# Altium project LM96000.PrjPcb
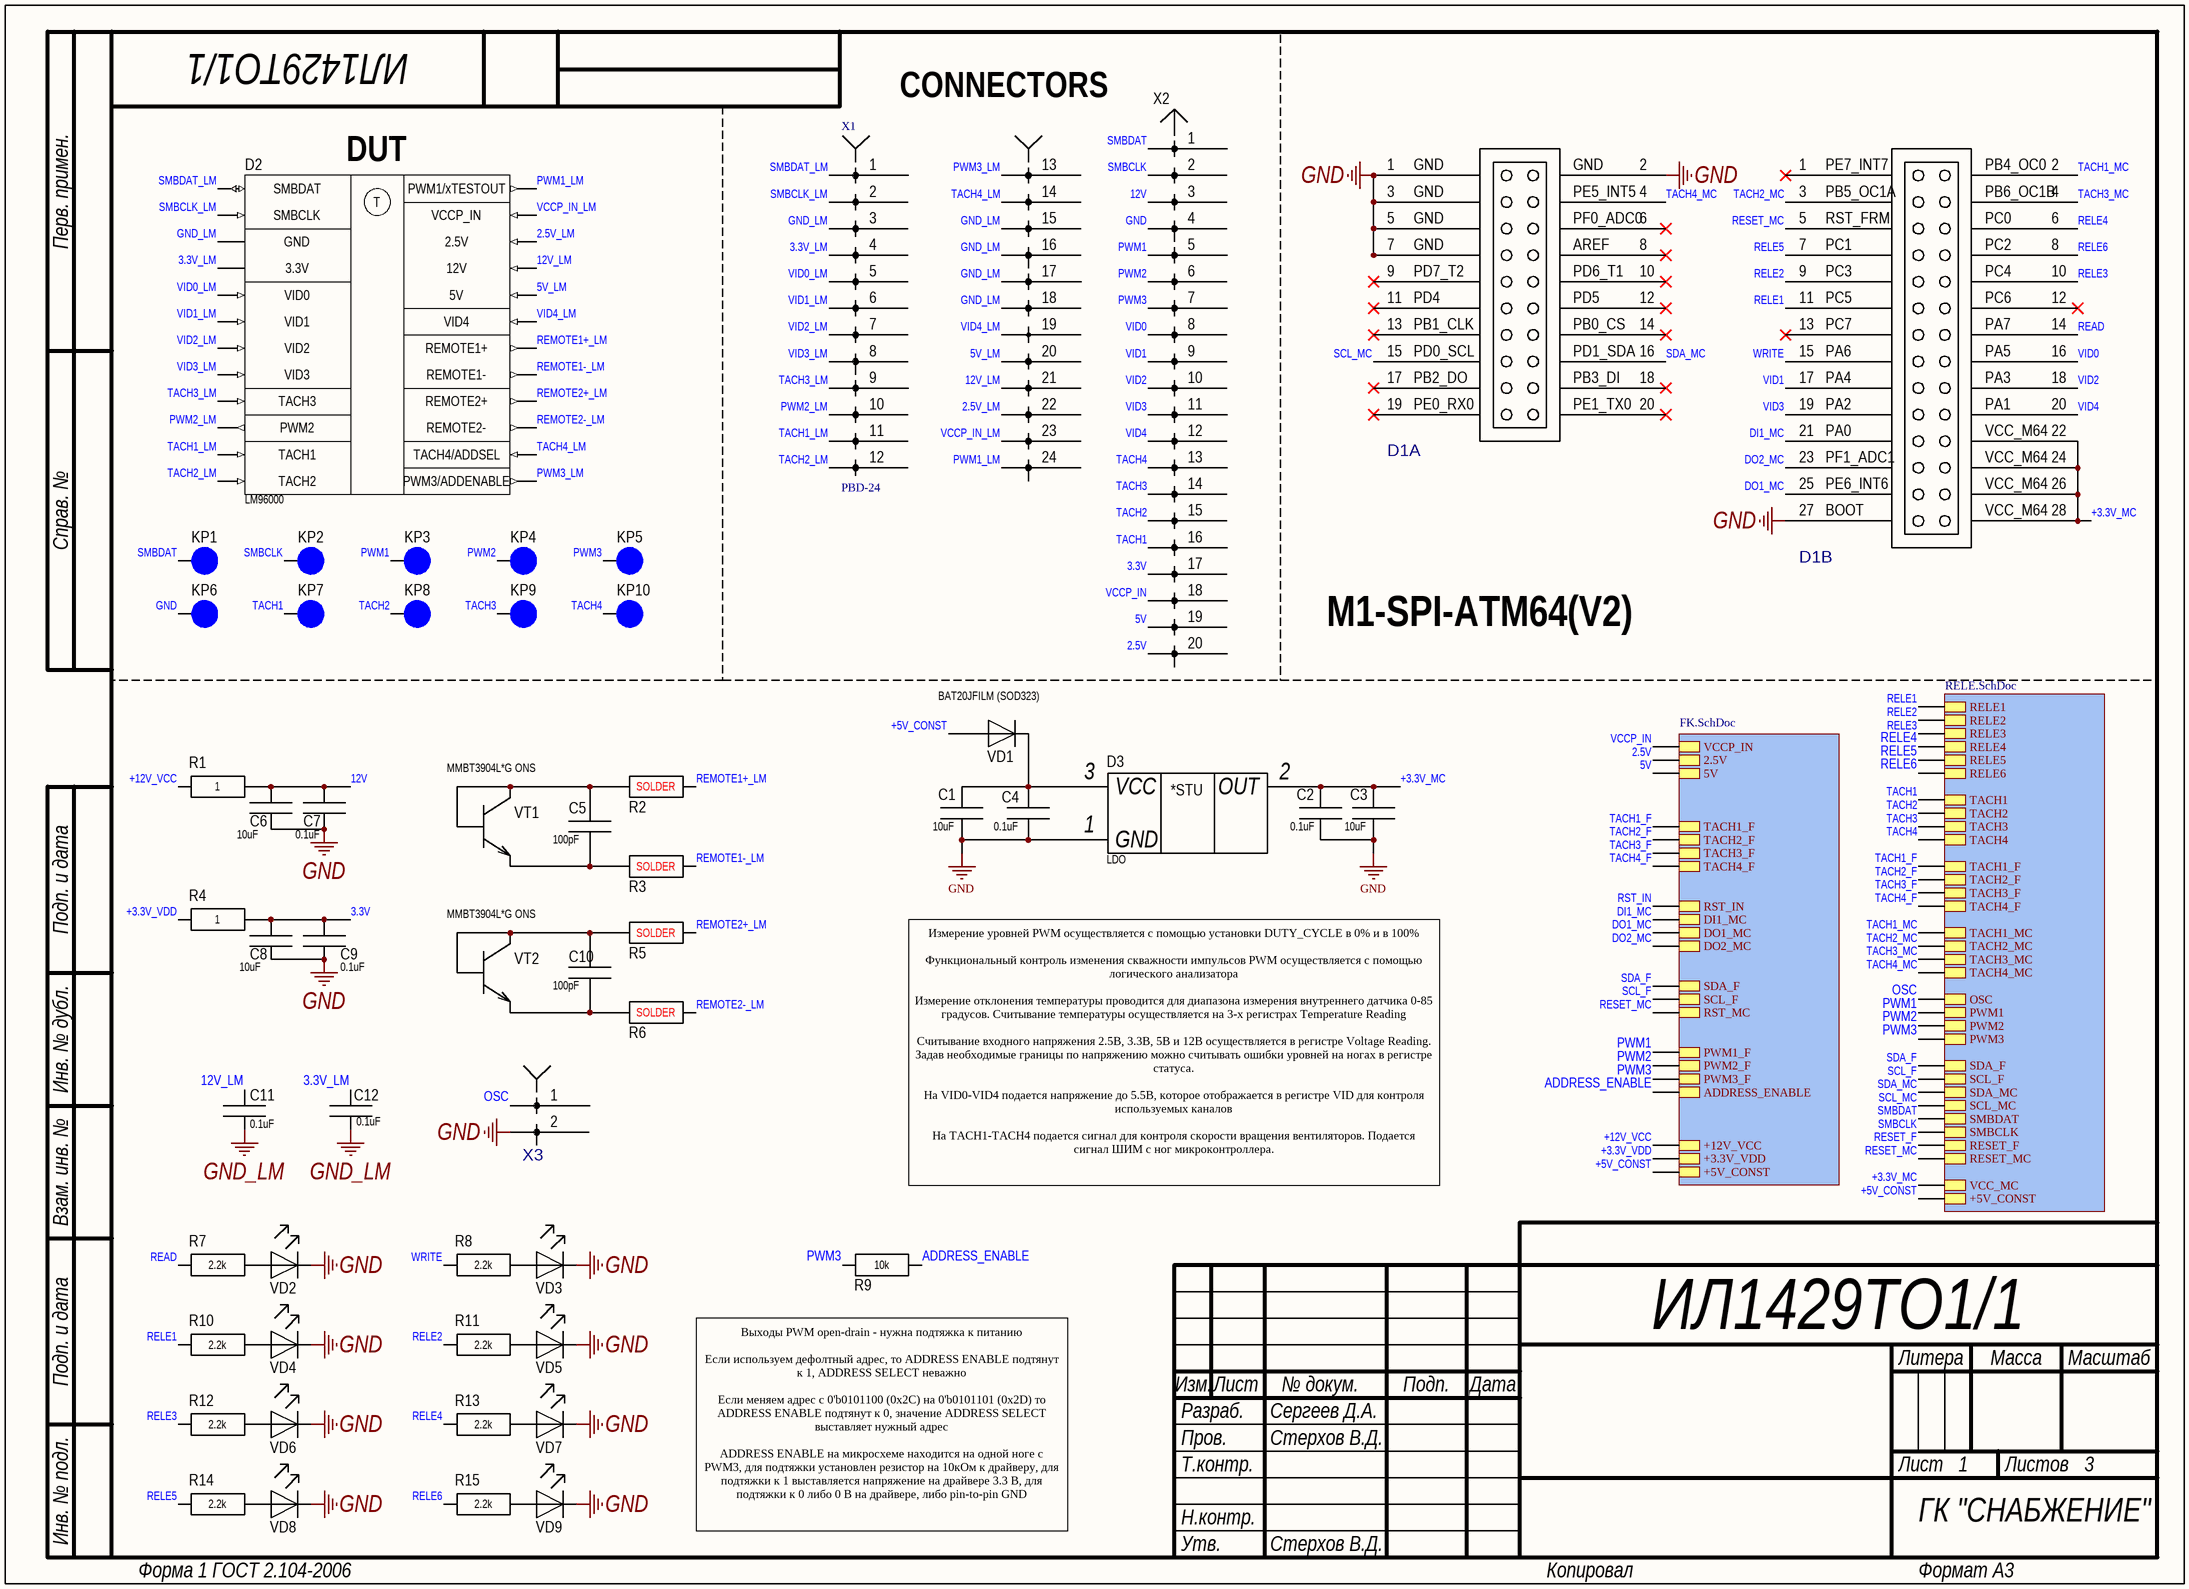
[diagram p0: main.SchDoc]
3 sheets, 104 parts. Net scope: hierarchical (ports join the sheet entries above them; power ports are global).
Board file: PCB1.PcbDoc
Sheets:
  main.SchDoc
    UCP_s25 = RELE.SchDoc
    UCP_s26 = FK.SchDoc

## Sheet main.SchDoc: ИЛ1429ТО1/1
size 410 x 297 mm; ApprovedBy: Стерхов В.Д.; CheckedBy: Стерхов В.Д.; Author: Сергеев Д.А.; CompanyName: ГК "СНАБЖЕНИЕ"; DrawnBy: Сергеев Д.А.; Engineer: Сергеев Д.А.; Organization: ГК "СНАБЖЕНИЕ"; DocumentNumber: ИЛ1429ТО1/1; Revision: 1; SheetNumber: 1; SheetTotal: 3

### Parts
C1  10uF  [0805]
C2  0.1uF  [0805]
C3  10uF  [0805]
C4  0.1uF  [0805]
C5  100pF  [0805]
C6  10uF  [0805]
C7  0.1uF  [0805]
C8  10uF  [0805]
C9  0.1uF  [0805]
C10  100pF  [0805]
C11  0.1uF  [0805]
C12  0.1uF  [0805]
D1  M1-SPI-ATM64(V2)  [M1-SPI-ATM64(V2)]  (value not drawn)  (parts A,B of 2)
D2  LM96000  [TSSOP-24 DIP-7.62]
D3  LDO  [SOT-223]
KP1  Contact  [Contact]  (value not drawn)
KP2  Contact  [Contact]  (value not drawn)
KP3  Contact  [Contact]  (value not drawn)
KP4  Contact  [Contact]  (value not drawn)
KP5  Contact  [Contact]  (value not drawn)
KP6  Contact  [Contact]  (value not drawn)
KP7  Contact  [Contact]  (value not drawn)
KP8  Contact  [Contact]  (value not drawn)
KP9  Contact  [Contact]  (value not drawn)
KP10  Contact  [Contact]  (value not drawn)
R1  1  [0805]
R2  SOLDER  [0603]
R3  SOLDER  [0603]
R4  1  [0805]
R5  SOLDER  [0603]
R6  SOLDER  [0603]
R7  2.2k  [0805]
R8  2.2k  [0805]
R9  10k  [0603]
R10  2.2k  [0805]
R11  2.2k  [0805]
R12  2.2k  [0805]
R13  2.2k  [0805]
R14  2.2k  [0805]
R15  2.2k  [0805]
VD1  BAT20JFILM (SOD323)  [SOD323]
VD2  LED(0805)  [0805(LED)]  (value not drawn)
VD3  LED(0805)  [0805(LED)]  (value not drawn)
VD4  LED(0805)  [0805(LED)]  (value not drawn)
VD5  LED(0805)  [0805(LED)]  (value not drawn)
VD6  LED(0805)  [0805(LED)]  (value not drawn)
VD7  LED(0805)  [0805(LED)]  (value not drawn)
VD8  LED(0805)  [0805(LED)]  (value not drawn)
VD9  LED(0805)  [0805(LED)]  (value not drawn)
VT1  MMBT3904L*G ONS  [SOT-23]
VT2  MMBT3904L*G ONS  [SOT-23]
X1  PBD-24  [PBD-24]
X2  PLD20-2,54  [PLD20-2,54]  (value not drawn)
X3  KLS1-SMA002-B  [KLS1-SMA002-B]  (value not drawn)

### Sub-sheets
UCP_s25 = RELE.SchDoc: SCL_F, +5V_CONST, RELE1, RELE2, RELE3, RESET_F, SDA_MC, VCC_MC, SCL_MC, SDA_F, RESET_MC, TACH2_MC, TACH4, TACH4_MC, TACH3_MC, TACH3, TACH1, TACH1_MC, TACH2, TACH3_F, TACH4_F, TACH1_F, TACH2_F, SMBCLK, SMBDAT, RELE6, RELE5, OSC, RELE4, PWM3, PWM2, PWM1
UCP_s26 = FK.SchDoc: 2.5V, TACH1_F, 5V, DI1_MC, RST_IN, TACH4_F, TACH3_F, TACH2_F, VCCP_IN, SDA_F, +5V_CONST, DO2_MC, RST_MC, SCL_F, DO1_MC, +12V_VCC, +3.3V_VDD, PWM2_F, PWM3_F, PWM1_F, ADDRESS_ENABLE

### Nets
GND: C1.2 C2.2 C3.2 C4.2 C6.2 C7.2 C8.2 C9.2 D1.1X2 D1.2X2 D1.3X2 D1.5X2 D1.7X2 D1.27X3 D3.1(GND) KP6.1 VD2.2(K) VD3.2(K) VD4.2(K) VD5.2(K) VD6.2(K) VD7.2(K) VD8.2(K) VD9.2(K) X2.4 X3.2
GND_LM: C11.2 C12.2 D2.3 X1.3 X1.15 X1.16 X1.17 X1.18
2.5V: X2.20 ; sheet UCP_s26/2.5V
2.5V_LM: D2.22 X1.22
3.3V: C8.1 C9.1 R4.2 X2.17
3.3V_LM: C12.1 D2.4 X1.4
5V: X2.19 ; sheet UCP_s26/5V
5V_LM: D2.20 X1.20
12V: C6.1 C7.1 R1.2 X2.3
12V_LM: C11.1 D2.21 X1.21
+3.3V_MC: C2.1 C3.1 D1.22X3 D1.24X3 D1.26X3 D1.28X3 D3.2(OUT) ; sheet UCP_s25/VCC_MC
+3.3V_VDD: R4.1 ; sheet UCP_s26/+3.3V_VDD
+5V_CONST: VD1.1(A) ; sheet UCP_s25/+5V_CONST, sheet UCP_s26/+5V_CONST
+12V_VCC: R1.1 ; sheet UCP_s26/+12V_VCC
ADDRESS_ENABLE: R9.2 ; sheet UCP_s26/ADDRESS_ENABLE
DI1_MC: D1.21X3 ; sheet UCP_s26/DI1_MC
DO1_MC: D1.25X3 ; sheet UCP_s26/DO1_MC
DO2_MC: D1.23X3 ; sheet UCP_s26/DO2_MC
OSC: X3.1 ; sheet UCP_s25/OSC
PWM1: KP3.1 X2.5 ; sheet UCP_s25/PWM1, sheet UCP_s26/PWM1_F
PWM1_LM: D2.24 X1.24
PWM2: KP4.1 X2.6 ; sheet UCP_s25/PWM2, sheet UCP_s26/PWM2_F
PWM2_LM: D2.10 X1.10
PWM3: KP5.1 R9.1 X2.7 ; sheet UCP_s25/PWM3, sheet UCP_s26/PWM3_F
PWM3_LM: D2.13 X1.13
READ: D1.14X3 R7.1
RELE1: D1.11X3 R10.1 ; sheet UCP_s25/RELE1
RELE2: D1.9X3 R11.1 ; sheet UCP_s25/RELE2
RELE3: D1.10X3 R12.1 ; sheet UCP_s25/RELE3
RELE4: D1.6X3 R13.1 ; sheet UCP_s25/RELE4
RELE5: D1.7X3 R14.1 ; sheet UCP_s25/RELE5
RELE6: D1.8X3 R15.1 ; sheet UCP_s25/RELE6
REMOTE1+_LM: D2.18 R2.2
REMOTE1-_LM: D2.17 R3.2
REMOTE2+_LM: D2.16 R5.2
REMOTE2-_LM: D2.15 R6.2
RESET_F: sheet UCP_s25/RESET_F
RESET_MC: D1.5X3 ; sheet UCP_s25/RESET_MC, sheet UCP_s26/RST_MC
SCL_F: sheet UCP_s25/SCL_F, sheet UCP_s26/SCL_F
SCL_MC: D1.15X2 ; sheet UCP_s25/SCL_MC
SDA_F: sheet UCP_s25/SDA_F, sheet UCP_s26/SDA_F
SDA_MC: D1.16X2 ; sheet UCP_s25/SDA_MC
SMBCLK: KP2.1 X2.2 ; sheet UCP_s25/SMBCLK
SMBCLK_LM: D2.2 X1.2
SMBDAT: KP1.1 X2.1 ; sheet UCP_s25/SMBDAT
SMBDAT_LM: D2.1 X1.1
TACH1: KP7.1 X2.16 ; sheet UCP_s25/TACH1
TACH1_F: sheet UCP_s25/TACH1_F, sheet UCP_s26/TACH1_F
TACH1_LM: D2.11 X1.11
TACH1_MC: D1.2X3 ; sheet UCP_s25/TACH1_MC
TACH2: KP8.1 X2.15 ; sheet UCP_s25/TACH2
TACH2_F: sheet UCP_s25/TACH2_F, sheet UCP_s26/TACH2_F
TACH2_LM: D2.12 X1.12
TACH2_MC: D1.3X3 ; sheet UCP_s25/TACH2_MC
TACH3: KP9.1 X2.14 ; sheet UCP_s25/TACH3
TACH3_F: sheet UCP_s25/TACH3_F, sheet UCP_s26/TACH3_F
TACH3_LM: D2.9 X1.9
TACH3_MC: D1.4X3 ; sheet UCP_s25/TACH3_MC
TACH4: KP10.1 X2.13 ; sheet UCP_s25/TACH4
TACH4_F: sheet UCP_s25/TACH4_F, sheet UCP_s26/TACH4_F
TACH4_LM: D2.14 X1.14
TACH4_MC: D1.4X2 ; sheet UCP_s25/TACH4_MC
VCCP_IN: X2.18 ; sheet UCP_s26/VCCP_IN
VCCP_IN_LM: D2.23 X1.23
VID0: D1.16X3 X2.8
VID0_LM: D2.5 X1.5
VID1: D1.17X3 X2.9
VID1_LM: D2.6 X1.6
VID2: D1.18X3 X2.10
VID2_LM: D2.7 X1.7
VID3: D1.19X3 X2.11
VID3_LM: D2.8 X1.8
VID4: D1.20X3 X2.12
VID4_LM: D2.19 X1.19
WRITE: D1.15X3 R8.1
NetC1_1: C1.1 C4.1 D3.3(VCC) VD1.2(K)
NetC5_1: C5.1 R2.1 VT1.1(B) VT1.3(K)
NetC5_2: C5.2 R3.1 VT1.2(E)
NetC10_1: C10.1 R5.1 VT2.1(B) VT2.3(K)
NetC10_2: C10.2 R6.1 VT2.2(E)
NetR7_2: R7.2 VD2.1(A)
NetR8_2: R8.2 VD3.1(A)
NetR10_2: R10.2 VD4.1(A)
NetR11_2: R11.2 VD5.1(A)
NetR12_2: R12.2 VD6.1(A)
NetR13_2: R13.2 VD7.1(A)
NetR14_2: R14.2 VD8.1(A)
NetR15_2: R15.2 VD9.1(A)

Not connected (* = marked no-connect by the designer): D1 1X3* 6X2* 8X2* 9X2* 10X2* 11X2* 12X2* 12X3* 13X2* 13X3* 14X2* 17X2* 18X2* 19X2* 20X2*

### Notes on the sheet
- CONNECTORS
- (near D2) DUT
- M1-SPI-ATM64(V2)
- Измерение уровней PWM осуществляется с помощью установки DUTY_CYCLE в 0% и в 100%
  Функциональный контроль изменения скважности импульсов PWM осуществляется с помощью логического анализатора
  Измерение отклонения температуры проводится для диапазона измерения внутреннего датчика 0-85 градусов. Считывание температуры осуществляется на 3-х регистрах Temperature Reading
  Считывание входного напряжения 2.5В, 3.3В, 5В и 12В осуществляется в регистре Voltage Reading. Задав необходимые границы по напряжению можно считывать ошибки уровней на ногах в регистре статуса.
  На VID0-VID4 подается напряжение до 5.5В, которое отображается в регистре VID для контроля используемых каналов
  На TACH1-TACH4 подается сигнал для контроля скорости вращения вентиляторов. Подается сигнал ШИМ с ног микроконтроллера.
- (near R9) Выходы PWM open-drain - нужна подтяжка к питанию
  Если используем дефолтный адрес, то ADDRESS ENABLE подтянут к 1, ADDRESS SELECT неважно
  Если меняем адрес с 0'b0101100 (0x2C) на 0'b0101101 (0x2D) то ADDRESS ENABLE подтянут к 0, значение ADDRESS SELECT выставляет нужный адрес
  ADDRESS ENABLE на микросхеме находится на одной ноге с PWM3, для подтяжки установлен резистор на 10кОм к драйверу, для подтяжки к 1 выставляется напряжение на драйвере 3.3 В, для подтяжки к 0 либо 0 В на драйвере, либо pin-to-pin GND
- Перв. примен.
- Справ. №
- Подп. и дата
- Инв. № дубл.
- Взам. инв. №
- Разраб.
- Изм.
- Лист
- № докум.
- Подп.
- Дата
- Литера
- Масса
- Масштаб
- Пров.
- Т.контр.
- Листов
- Инв. № подл.
- Н.контр.
- Утв.
- Форма 1 ГОСТ 2.104-2006
- Копировал
- Формат А3
- (in symbol OpAmpType3) OUT; V+; V-; DOP; +IN; -IN; EP

### Library data of the parts
C1-C12 = C0805: ComponentHeigt: 1.3; Firme: AVX; Leadform: SMD; KIND: Конденсатор; ClassName: *; Component Link: *; ComponentWeigt: *; Packaging: 0805; NN: *; Value: *
D1 = M1-SPI-ATM64(V2): ComponentHeigt: 5.5; Name: Вилка; Specification: Вилка PLD2-2 *; Typ: PLD2-2; ClassName: *; Component Link: *; ComponentWeigt: *; Firme: *; Leadform: *; NN: *; KIND: *
D3 = AMS1117-3.3 (SOT-223)
R1 R4 R7 R8 R10-R15 = R0805 Yageo: ComponentHeigt: 0.6; Firme: Yageo; Leadform: SMD; Kind: Резистор; ClassName: *; ComponentWeigt: *; Component Link: *; Packaging: 0805; NN: *; Value: *
R2 R3 R5 R6 R9 = R0603 Yageo: ComponentHeigt: 0.5; Leadform: SMD; Firme: Yageo; Kind: Резистор; Packaging: 0402; ClassName: *; Component Link: *; NN: *
VD1 = BAT20JFILM (SOD323): ComponentHeigt: 0.75; Leadform: в отверстия; Firme: Kingbright; NN: 24003000; KIND: Светодиод L-1154GD Kingbright; Component Link: *; ClassName: *
VD2-VD9 = LED(0805): ComponentHeigt: 0.75; Leadform: в отверстия; Firme: Kingbright; NN: 24003000; KIND: Светодиод L-1154GD Kingbright; Component Link: *; ClassName: *
VT1 VT2 = MMBT3904L*G ONS: ComponentHeigt: 1.1; Leadform: SMD; NN: 24006226; KIND: Транзистор MMBT3904L*G ONS; ClassName: *; ComponentWeigt: *; Firme: ONS; Packaging: SOT-23
X2 = PLD20-2,54: Посадочное место для проводов на ТО; ComponentHeigt: 5.5; Name: Вилка; Specification: Вилка PLD2-2 *; Typ: PLD2-2; ClassName: *; Component Link: *; ComponentWeigt: *; Firme: *; Leadform: *; NN: *; KIND: *
X3 = KLS1-SMA002-B: ComponentHeigt: 5.5; Name: Вилка; Specification: Вилка PLD2-2 *; Typ: PLD2-2; ClassName: *; Component Link: *; ComponentWeigt: *; Firme: *; Leadform: *; NN: *; KIND: *

## Sheet RELE.SchDoc: ИЛ1429ТО1/1
size 410 x 297 mm; ApprovedBy: Стерхов В.Д.; CheckedBy: Стерхов В.Д.; Author: Сергеев Д.А.; CompanyName: ГК "СНАБЖЕНИЕ"; DrawnBy: Сергеев Д.А.; Engineer: Сергеев Д.А.; Organization: ГК "СНАБЖЕНИЕ"; DocumentNumber: ИЛ1429ТО1/1; Revision: 1; SheetNumber: 2; SheetTotal: 3
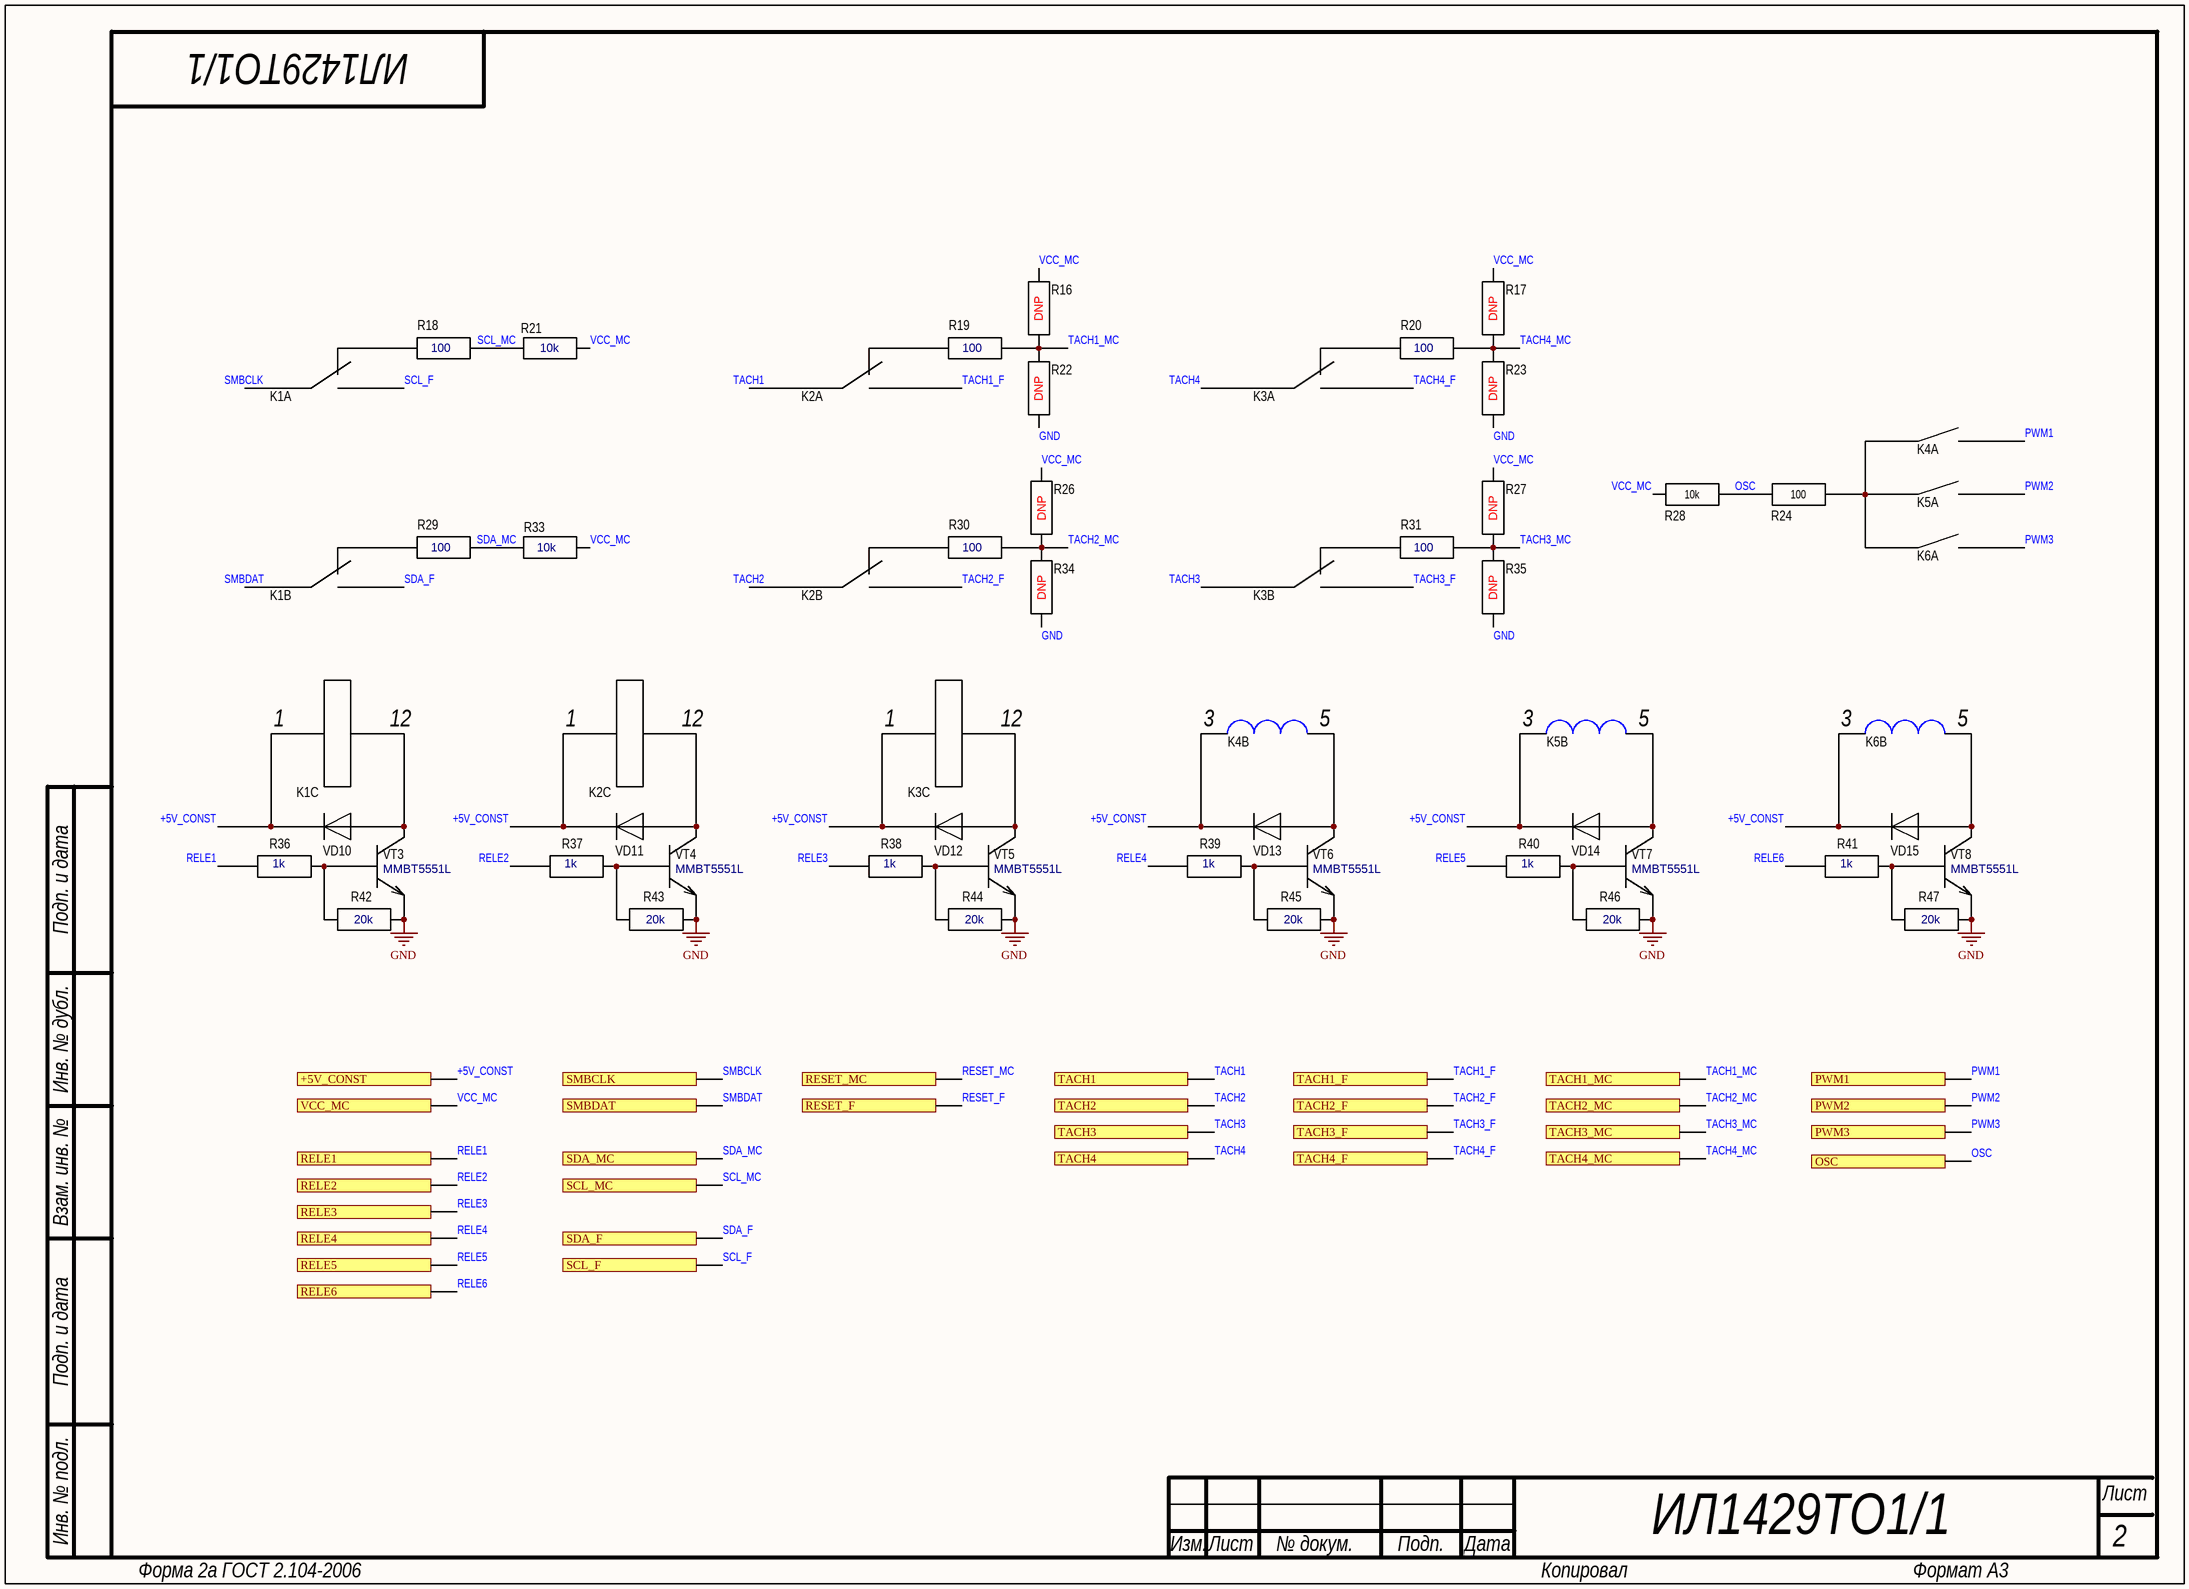
[diagram p1: RELE.SchDoc]

### Parts
K1  V23079A1001B301 TE  [V23079A1001B301]  (value not drawn)  (parts A,B,C of 3)
K2  V23079A1001B301 TE  [V23079A1001B301]  (value not drawn)  (parts A,B,C of 3)
K3  V23079A1001B301 TE  [V23079A1001B301]  (value not drawn)  (parts A,B,C of 3)
K4  TRR1A05F00  [TRR1A05F00]  (value not drawn)  (parts A,B of 2)
K5  TRR1A05F00  [TRR1A05F00]  (value not drawn)  (parts A,B of 2)
K6  TRR1A05F00  [TRR1A05F00]  (value not drawn)  (parts A,B of 2)
R16  DNP  [0805]
R17  DNP  [0805]
R18  100  [0805]
R19  100  [0805]
R20  100  [0805]
R21  10k  [0805]
R22  DNP  [0805]
R23  DNP  [0805]
R24  100  [0603]
R26  DNP  [0805]
R27  DNP  [0805]
R28  10k  [0603]
R29  100  [0805]
R30  100  [0805]
R31  100  [0805]
R33  10k  [0805]
R34  DNP  [0805]
R35  DNP  [0805]
R36  1k  [0805]
R37  1k  [0805]
R38  1k  [0805]
R39  1k  [0805]
R40  1k  [0805]
R41  1k  [0805]
R42  20k  [0805]
R43  20k  [0805]
R44  20k  [0805]
R45  20k  [0805]
R46  20k  [0805]
R47  20k  [0805]
VD10  LL4148 NXP  [SOD80C]  (value not drawn)
VD11  LL4148 NXP  [SOD80C]  (value not drawn)
VD12  LL4148 NXP  [SOD80C]  (value not drawn)
VD13  LL4148 NXP  [SOD80C]  (value not drawn)
VD14  LL4148 NXP  [SOD80C]  (value not drawn)
VD15  LL4148 NXP  [SOD80C]  (value not drawn)
VT3  MMBT5551L  [SOT-23]
VT4  MMBT5551L  [SOT-23]
VT5  MMBT5551L  [SOT-23]
VT6  MMBT5551L  [SOT-23]
VT7  MMBT5551L  [SOT-23]
VT8  MMBT5551L  [SOT-23]

### Ports
+5V_CONST, OSC, PWM1, PWM2, PWM3, RELE1, RELE2, RELE3, RELE4, RELE5, RELE6, RESET_F, RESET_MC, SCL_F, SCL_MC, SDA_F, SDA_MC, SMBCLK, SMBDAT, TACH1, TACH1_F, TACH1_MC, TACH2, TACH2_F, TACH2_MC, TACH3, TACH3_F, TACH3_MC, TACH4, TACH4_F, TACH4_MC, VCC_MC

### Nets
GND: R22.1 R23.1 R34.1 R35.1 R42.2 R43.2 R44.2 R45.2 R46.2 R47.2 VT3.2(E) VT4.2(E) VT5.2(E) VT6.2(E) VT7.2(E) VT8.2(E)
+5V_CONST: K1.1 K2.1 K3.1 K4.3 K5.3 K6.3 VD10.2(K) VD11.2(K) VD12.2(K) VD13.2(K) VD14.2(K) VD15.2(K) ; port +5V_CONST
OSC: R24.1 R28.2 ; port OSC
PWM1: K4.7 ; port PWM1
PWM2: K5.7 ; port PWM2
PWM3: K6.7 ; port PWM3
RELE1: R36.1 ; port RELE1
RELE2: R37.1 ; port RELE2
RELE3: R38.1 ; port RELE3
RELE4: R39.1 ; port RELE4
RELE5: R40.1 ; port RELE5
RELE6: R41.1 ; port RELE6
RESET_F: port RESET_F
SCL_F: K1.5 ; port SCL_F
SCL_MC: R18.2 R21.1 ; port SCL_MC
SDA_F: K1.8 ; port SDA_F
SDA_MC: R29.2 R33.1 ; port SDA_MC
SMBCLK: K1.4 ; port SMBCLK
SMBDAT: K1.9 ; port SMBDAT
TACH1: K2.4 ; port TACH1
TACH1_F: K2.5 ; port TACH1_F
TACH1_MC: R16.1 R19.2 R22.2 ; port TACH1_MC
TACH2: K2.9 ; port TACH2
TACH2_F: K2.8 ; port TACH2_F
TACH2_MC: R26.1 R30.2 R34.2 ; port TACH2_MC
TACH3: K3.9 ; port TACH3
TACH3_F: K3.8 ; port TACH3_F
TACH3_MC: R27.1 R31.2 R35.2 ; port TACH3_MC
TACH4: K3.4 ; port TACH4
TACH4_F: K3.5 ; port TACH4_F
TACH4_MC: R17.1 R20.2 R23.2 ; port TACH4_MC
VCC_MC: R16.2 R17.2 R21.2 R26.2 R27.2 R28.1 R33.2 ; port VCC_MC  [project net +3.3V_MC]
NetK1_3: K1.3 R18.1
NetK1_10: K1.10 R29.1
NetK1_12: K1.12 VD10.1(A) VT3.3(K)
NetK2_3: K2.3 R19.1
NetK2_10: K2.10 R30.1
NetK2_12: K2.12 VD11.1(A) VT4.3(K)
NetK3_3: K3.3 R20.1
NetK3_10: K3.10 R31.1
NetK3_12: K3.12 VD12.1(A) VT5.3(K)
NetK4_1: K4.1 K5.1 K6.1 R24.2
NetK4_5: K4.5 VD13.1(A) VT6.3(K)
NetK5_5: K5.5 VD14.1(A) VT7.3(K)
NetK6_5: K6.5 VD15.1(A) VT8.3(K)
NetR36_2: R36.2 R42.1 VT3.1(B)
NetR37_2: R37.2 R43.1 VT4.1(B)
NetR38_2: R38.2 R44.1 VT5.1(B)
NetR39_2: R39.2 R45.1 VT6.1(B)
NetR40_2: R40.2 R46.1 VT7.1(B)
NetR41_2: R41.2 R47.1 VT8.1(B)

### Notes on the sheet
- Подп. и дата
- Инв. № дубл.
- Взам. инв. №
- Инв. № подл.
- Изм.
- Лист
- № докум.
- Подп.
- Дата
- Форма 2а ГОСТ 2.104-2006
- Копировал
- Формат А3

### Library data of the parts
R16-R23 R26 R27 R29-R31 R33-R47 = R0805 Yageo: as R1 on sheet main; ClassName: *; ComponentWeigt: *; Component Link: *; Packaging: 0805; NN: *; Value: *
R24 R28 = R0603 Yageo: as R2 on sheet main; Packaging: 0402; ClassName: *; Component Link: *; NN: *
VD10-VD15 = LL4148 NXP: ComponentHeigt: 1.6; Leadform: SMD; NN: 24009301; KIND: Диод LL4148 NXP; Component Link: http://www.nxp.com; Packaging: SOD-80C; ClassName: *; Firme: NXP
VT3-VT8 = MMBT5551L: ComponentHeigt: 1.1; Firme: ONS; Leadform: SMD; NN: 24007468; KIND: Транзистор MMBT5551L*G ONS; ClassName: *; ComponentWeigt: *; Packaging: SOT-23

## Sheet FK.SchDoc: ИЛ1429ТО1/1
size 410 x 297 mm; ApprovedBy: Стерхов В.Д.; CheckedBy: Стерхов В.Д.; Author: Сергеев Д.А.; CompanyName: ГК "СНАБЖЕНИЕ"; DrawnBy: Сергеев Д.А.; Engineer: Сергеев Д.А.; Organization: ГК "СНАБЖЕНИЕ"; DocumentNumber: ИЛ1429ТО1/1; Revision: 1; SheetNumber: 3; SheetTotal: 3
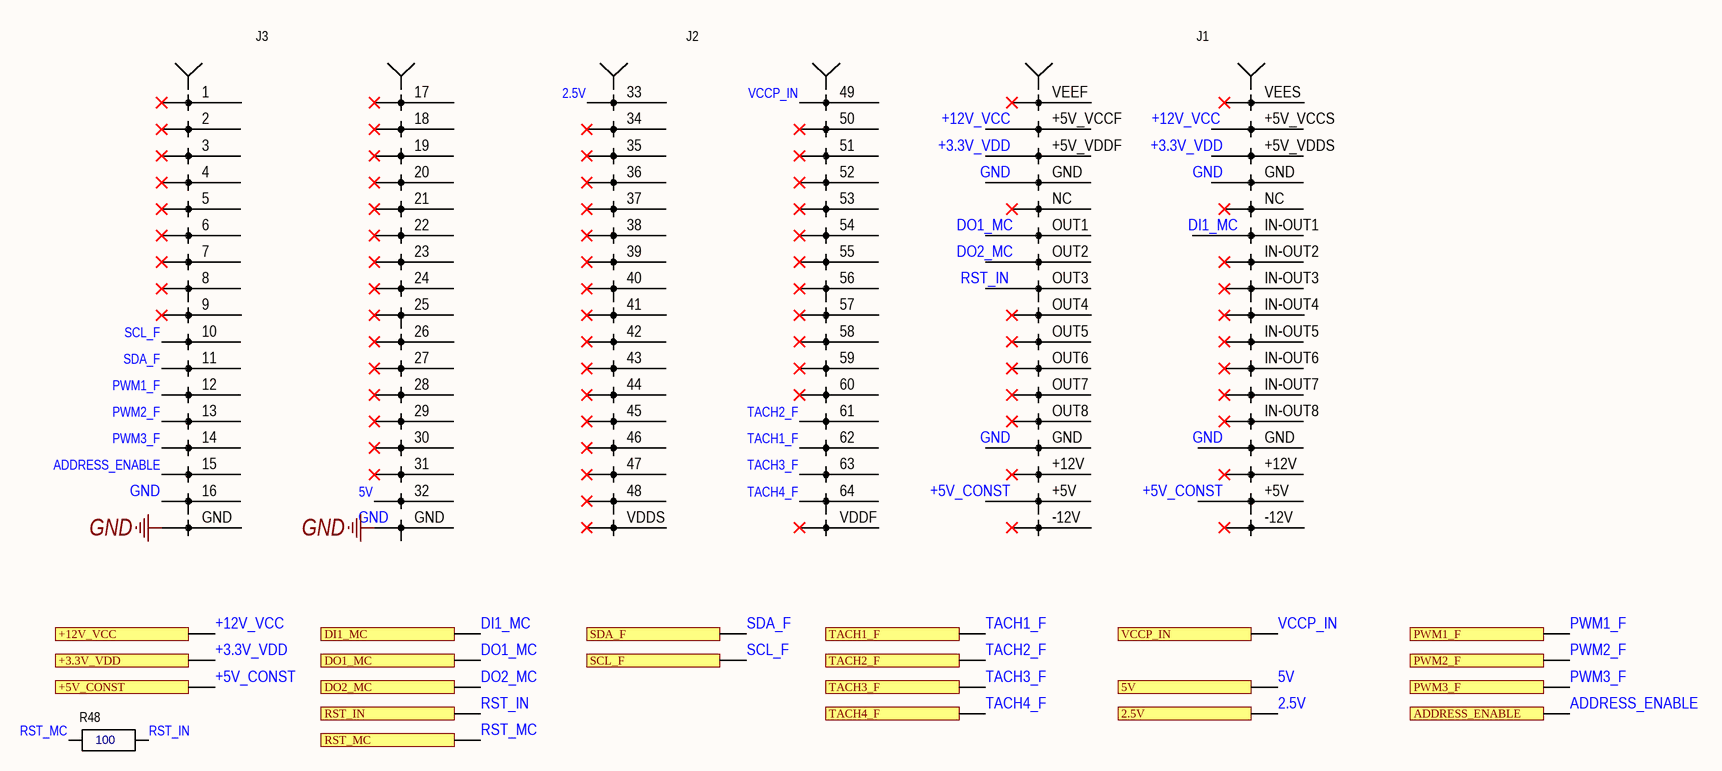
[diagram p2: FK.SchDoc]

### Parts
R48  100  [0805]
X4  FORMULA  [FORMULA]  (value not drawn)

### Ports
2.5V, 5V, +3.3V_VDD, +5V_CONST, +12V_VCC, ADDRESS_ENABLE, DI1_MC, DO1_MC, DO2_MC, PWM1_F, PWM2_F, PWM3_F, RST_IN, RST_MC, SCL_F, SDA_F, TACH1_F, TACH2_F, TACH3_F, TACH4_F, VCCP_IN

### Nets
GND: X4.16 X4.GND
2.5V: X4.33 ; port 2.5V
5V: X4.32 ; port 5V
+3.3V_VDD: X4.+5V_VDDF(VDDF) X4.+5V_VDDS(VDDS) ; port +3.3V_VDD
+5V_CONST: X4.+5V ; port +5V_CONST
+12V_VCC: X4.+5V_VCCF(VCCF) X4.+5V_VCCS(VCCS) ; port +12V_VCC
ADDRESS_ENABLE: X4.15 ; port ADDRESS_ENABLE
DI1_MC: X4.IN-OUT1 ; port DI1_MC
DO1_MC: X4.OUT1 ; port DO1_MC
DO2_MC: X4.OUT2 ; port DO2_MC
PWM1_F: X4.12 ; port PWM1_F  [project net PWM1]
PWM2_F: X4.13 ; port PWM2_F  [project net PWM2]
PWM3_F: X4.14 ; port PWM3_F  [project net PWM3]
RST_IN: R48.2 X4.OUT3 ; port RST_IN
RST_MC: R48.1 ; port RST_MC  [project net RESET_MC]
SCL_F: X4.10 ; port SCL_F
SDA_F: X4.11 ; port SDA_F
TACH1_F: X4.62 ; port TACH1_F
TACH2_F: X4.61 ; port TACH2_F
TACH3_F: X4.63 ; port TACH3_F
TACH4_F: X4.64 ; port TACH4_F
VCCP_IN: X4.49 ; port VCCP_IN

Not connected (* = marked no-connect by the designer): X4 1* 2* 3* 4* 5* 6* 7* 8* 9* 17* 18* 19* 20* 21* 22* 23* 24* 25* 26* 27* 28* 29* 30* 31* 34* 35* 36(4)* 37(5)* 38* 39* 40* 41* 42* 43* 44* 45* 46* 47* 48* 50* 51* 52* 53* 54* 55* 56* 57* 58* 59* 60* +12V* -12V* IN-OUT2* IN-OUT3* IN-OUT4* IN-OUT5* IN-OUT6* IN-OUT7* IN-OUT8* NC* OUT4* OUT5* OUT6* OUT7* OUT8* VDDF* VDDS* VEEF* VEES*

### Notes on the sheet
- Подп. и дата
- Инв. № дубл.
- Взам. инв. №
- Инв. № подл.
- Изм.
- Лист
- № докум.
- Подп.
- Дата
- Форма 2а ГОСТ 2.104-2006
- Копировал
- Формат А3
- (in symbol FORMULA) J3; J2; J1

### Library data of the parts
R48 = R0805 Yageo: as R1 on sheet main; ClassName: *; ComponentWeigt: *; Component Link: *; Packaging: 0805; NN: *; Value: *

## Nets that join several sheets
GND: main (26 pins), RELE (16 pins), FK (X4.16 X4.GND)
2.5V: main (X2.20), FK (X4.33)
5V: main (X2.19), FK (X4.32)
+3.3V_MC: main (7 pins), RELE (7 pins)
+3.3V_VDD: main (R4.1), FK (X4.+5V_VDDF X4.+5V_VDDS)
+5V_CONST: main (VD1.1), RELE (12 pins), FK (X4.+5V)
+12V_VCC: main (R1.1), FK (X4.+5V_VCCF X4.+5V_VCCS)
ADDRESS_ENABLE: main (R9.2), FK (X4.15)
DI1_MC: main (D1.21X3), FK (X4.IN-OUT1)
DO1_MC: main (D1.25X3), FK (X4.OUT1)
DO2_MC: main (D1.23X3), FK (X4.OUT2)
OSC: main (X3.1), RELE (R24.1 R28.2)
PWM1: main (KP3.1 X2.5), RELE (K4.7), FK (X4.12)
PWM2: main (KP4.1 X2.6), RELE (K5.7), FK (X4.13)
PWM3: main (KP5.1 R9.1 X2.7), RELE (K6.7), FK (X4.14)
RELE1: main (D1.11X3 R10.1), RELE (R36.1)
RELE2: main (D1.9X3 R11.1), RELE (R37.1)
RELE3: main (D1.10X3 R12.1), RELE (R38.1)
RELE4: main (D1.6X3 R13.1), RELE (R39.1)
RELE5: main (D1.7X3 R14.1), RELE (R40.1)
RELE6: main (D1.8X3 R15.1), RELE (R41.1)
RESET_MC: main (D1.5X3), FK (R48.1)
SCL_F: RELE (K1.5), FK (X4.10)
SCL_MC: main (D1.15X2), RELE (R18.2 R21.1)
SDA_F: RELE (K1.8), FK (X4.11)
SDA_MC: main (D1.16X2), RELE (R29.2 R33.1)
SMBCLK: main (KP2.1 X2.2), RELE (K1.4)
SMBDAT: main (KP1.1 X2.1), RELE (K1.9)
TACH1: main (KP7.1 X2.16), RELE (K2.4)
TACH1_F: RELE (K2.5), FK (X4.62)
TACH1_MC: main (D1.2X3), RELE (R16.1 R19.2 R22.2)
TACH2: main (KP8.1 X2.15), RELE (K2.9)
TACH2_F: RELE (K2.8), FK (X4.61)
TACH2_MC: main (D1.3X3), RELE (R26.1 R30.2 R34.2)
TACH3: main (KP9.1 X2.14), RELE (K3.9)
TACH3_F: RELE (K3.8), FK (X4.63)
TACH3_MC: main (D1.4X3), RELE (R27.1 R31.2 R35.2)
TACH4: main (KP10.1 X2.13), RELE (K3.4)
TACH4_F: RELE (K3.5), FK (X4.64)
TACH4_MC: main (D1.4X2), RELE (R17.1 R20.2 R23.2)
VCCP_IN: main (X2.18), FK (X4.49)